# EasyEDA Pro project 电刺激_两块板_2026-10-19.epro, board PCB1
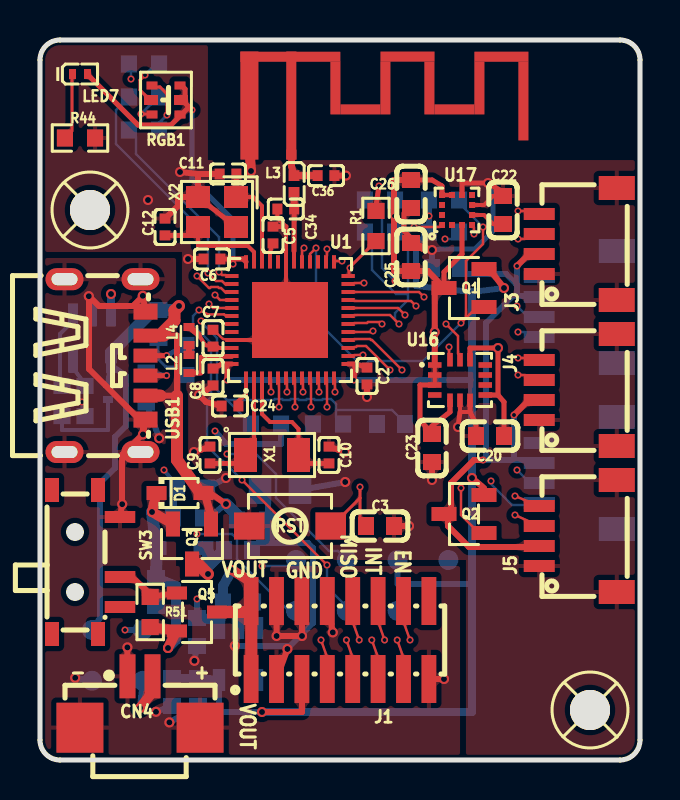
[diagram p7: board, top side]
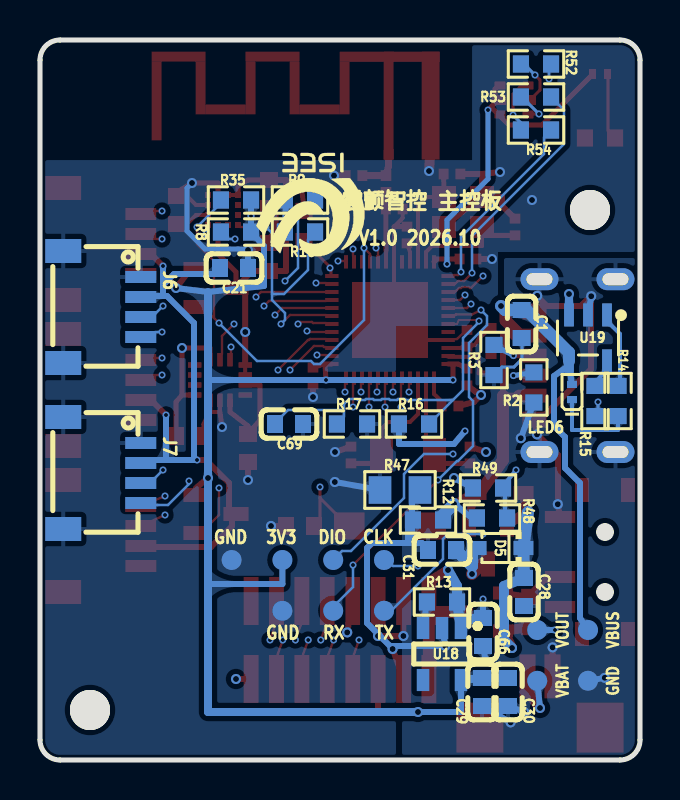
[diagram p8: board, bottom side, seen from below]

Outline 30 x 36 mm; copper layers: Top Layer, GND, SIG_PWR, Bottom Layer. Coordinates in mm from the lower left corner of the outline.
Outline path: 0,35 0,1 arc(0.29,0.29) 1,0 29,0 arc(29.71,0.29) 30,1 30,35 arc(29.71,35.71) 29,36 1,36 arc(0.29,35.71) 0,35
Stack: Top Layer 0.035mm Outer layer thickness 1oz / Dielectric1 0.2104mm 7628 RC49% 8.6mil / GND 0.035mm / Dielectric2 1.065mm 1.1mm H/HOZ Copper / SIG_PWR 0.035mm / Dielectric3 0.2104mm 7628 RC49% 8.6mil / Bottom Layer 0.035mm Outer layer thickness 1oz

## Design rules (mm)
net VBUS: PWR
net VBAT: PWR
net VOUT: PWR
net $1N356: RF
net $1N358: RF
net VOUT_IN: PWR
spacing copperThickness1oz (default): track to track 0.102, other pairs 0 to 0.3
spacing copperThickness2oz: track to track 0.203, other pairs 0.152 to 0.3
spacing HV_0.6mm: track to track 0.6, other pairs 0.152 to 0.6
track width copperThickness1oz (default): min 0.1, default 0.2, max 2.54
track width copperThickness2oz: min 0.203, default 0.254, max 2.54
track width HV_0.3: min 0.2, default 0.3, max 2.54
track width PWR_0.5: min 0.3, default 0.5, max 5
track width RF_50R: min 0.2, default 0.35, max 0.4
differential pair differentialPair (default): width min 0.127, default 0.254, max 2.54; gap min 0.152, default 0.152
net VBAT uses PWR_0.5
net VOUT uses PWR_0.5
net $1N356 uses RF_50R
net $1N358 uses RF_50R
net VOUT_IN uses PWR_0.5
net VBUS uses PWR_0.5
net class RF uses RF_50R
net class PWR uses PWR_0.5

## Placement (name value [footprint] x y rotation side)
C1  10uF  [C0603]  5.92 21.8 90 bottom
C2  100nF  [C0402]  16.35 19.2 270 top
C3  100nF  [C0603]  17 11.7 0 top
C5  100pF  [C0402]  11.65 26.25 90 top
C6  100nF  [C0402]  8.6 25.05 0 top
C7  1uF  [C0402]  8.65 21.09 270 top
C8  10uF  [C0402]  8.65 19.15 90 top
C9  12pF  [C0402]  8.5 15.25 90 top
C10  12pF  [C0402]  14.45 15.25 90 top
C11  12pF  [C0402]  9.4 29.3 180 top
C12  12pF  [C0402]  6.25 26.65 90 top
C20  10uF  [C0603]  22.5 16.2 0 top
C21  10uF  [C0603]  20.3 24.6 0 bottom
C22  220nF  [C0603]  23.15 27.5 270 top
C23  100nF  [C0603]  19.6 15.6 90 top
C24  100nF  [C0402]  9.5 17.7 0 top
C25  100nF  [C0603]  18.55 25.15 90 top
C26  100nF  [C0603]  18.55 28.3 90 top
C28  10uF  [C0603]  5.8 8.4 90 bottom
C29  10uF  [C0603]  7.9 3.4 90 bottom
C30  100nF  [C0603]  6.6 3.4 90 bottom
C31  10uF  [C0603]  9.9 10.5 180 bottom
C34  0.8pF  [C0402]  12.29 27.55 0 top
C36  1.2pF  [C0402]  14.3 29.22 0 top
C66  100nF  [C0603]  7.85 6.4 90 bottom
C69  100nF  [C0603]  17.55 16.8 0 bottom
CN4  HC-1.25-2PWT  [CONN-SMD_2P-P1.25-HC-1.25-2PWT]  5 2.9 0 top
D1  1N5819WS  [SOD-323_L1.8-W1.3-LS2.5-RD]  7 13.35 0 top
D5  1N5819WS  [SOD-323_L1.8-W1.3-LS2.5-RD]  7 10.6 0 bottom
J1  1.27mm,排针2*8P  [HDR-SMD_16P-P1.27-V-M-R2-C8-LS5.3]  15 6 0 top
J3  SM04B-SRSS-TB(LF)(SN)  [CONN-SMD_4P-P1.00_SM04B-SRSS-TB-LF-SN]  26.9 25.8 90 top
J4  SM04B-SRSS-TB(LF)(SN)  [CONN-SMD_4P-P1.00_SM04B-SRSS-TB-LF-SN]  26.9 18.5 90 top
J5  SM04B-SRSS-TB(LF)(SN)  [CONN-SMD_4P-P1.00_SM04B-SRSS-TB-LF-SN]  26.9 11.2 90 top
J6  SM04B-SRSS-TB(LF)(SN)  [CONN-SMD_4P-P1.00_SM04B-SRSS-TB-LF-SN]  26.9 22.65 270 bottom
J7  SM04B-SRSS-TB(LF)(SN)  [CONN-SMD_4P-P1.00_SM04B-SRSS-TB-LF-SN]  26.9 14.35 270 bottom
L2  10uH  [IND-SMD_L1.0-W0.5-2]  7.45 19.8 90 top
L3  3.9nH  [L0402]  12.7 28.8 90 top
L4  15nH  [IND-SMD_L1.0-W0.5-2]  7.45 21.2 90 top
LED6  NCD0402R1  [LED-SMD_L1.0-W0.5_FC-F1005UGK]  3.4 18.4 90 bottom
LED7  NCD0402R1  [LED-SMD_L1.0-W0.5_FC-F1005UGK]  2 34.3 0 top
Q1  NX2301P,215  [SOT-23-3_L2.9-W1.3-P1.90-LS2.4-BR#2]  21.2 23.6 0 top
Q2  NX2301P,215  [SOT-23-3_L2.9-W1.3-P1.90-LS2.4-BR#2]  21.2 12.3 0 top
Q3  SI2301  [SOT-23-3_L2.9-W1.3-P1.90-LS2.4-BR#2]  7.6 10.8 90 top
Q5  NX2301P,215  [SOT-23-3_L2.9-W1.3-P1.90-LS2.4-BR]  7.85 7.4 180 top
R1  10kΩ  [R0603]  16.8 26.7 90 top
R2  5.1kΩ  [R0603]  5.31 18.63 90 bottom
R3  5.1kΩ  [R0603]  7.3 20 90 bottom
R8  470kΩ  [R0603]  20.2 26.4 0 bottom
R9  1.1kΩ  [R0603]  17 28 0 bottom
R10  1.1kΩ  [R0603]  17 26.4 0 bottom
R12  10kΩ  [R0603]  10.6 12 180 bottom
R13  10kΩ  [R0603]  9.9 7.9 180 bottom
R14  1kΩ  [R0603]  1.1 17.95 270 bottom
R15  4.7kΩ  [R0603]  2.25 17.95 270 bottom
R16  1.1MΩ  [R0603]  11.3 16.8 0 bottom
R17  1.1MΩ  [R0603]  14.4 16.8 0 bottom
R35  470kΩ  [R0603]  20.2 28 0 bottom
R44  1kΩ  [R0603]  2 31.1 0 top
R47  0Ω  [R0805]  12 13.5 0 bottom
R48  100kΩ  [R0603]  7.4 12.1 0 bottom
R49  100kΩ  [R0603]  7.6 13.6 180 bottom
R51  100kΩ  [R0603]  5.51 7.4 90 top
R52  470Ω  [R0603]  5.2 34.8 0 bottom
R53  100Ω  [R0603]  5.2 33.15 0 bottom
R54  100Ω  [R0603]  5.2 31.5 0 bottom
RF1  RF_2.4G_ANT  [天线封装]  11.53 30.4 0 top
RGB1  19-337/R6GHBHC-A01/2T  [LED-ARRAY-SMD_6P-L1.6-W1.6-TL]  6.3 33 0 top
RST  轻触开关3x4x2  [Key_SMD_3x4x2]  12.5 11.7 0 top
SCREW3  -  [M2螺丝]  2.5 27.5 0 top
SCREW4  -  [M2螺丝]  27.5 2.5 0 top
SW3  MSK12C02  [SW-TH_MSK12C02]  2.3 9.9 270 top
TP1  -  [Test-Point-0.5mm]  20.42 10 0 bottom
TP2  -  [Test-Point-0.5mm]  12.8 10 0 bottom
TP3  -  [Test-Point-0.5mm]  15.34 10 0 bottom
TP4  -  [Test-Point-0.5mm]  17.88 10 0 bottom
TP5  -  [Test-Point-0.5mm]  17.88 7.46 0 bottom
TP6  -  [Test-Point-0.5mm]  12.8 7.46 0 bottom
TP7  -  [Test-Point-0.5mm]  15.34 7.46 0 bottom
TP20  -  [Test-Point-0.5mm]  2.6 6.5 0 bottom
TP21  -  [Test-Point-0.5mm]  5.14 3.96 0 bottom
TP22  -  [Test-Point-0.5mm]  5.14 6.5 0 bottom
TP23  -  [Test-Point-0.5mm]  2.6 3.96 0 bottom
U1  NRF52832-QFAA-R  [QFN-48_L6.0-W6.0-P0.40-BL-EP3.8]  12.5 22 0 top
U16  LSM6DS3TR-C  [LGA-14_L3.0-W2.5-P0.50-TL]  21 19 0 top
U17  LIS2MDLTR  [VLGA-12_L2.0-W2.0-P0.50-BL]  20.85 27.5 0 top
U18  AP2112K-3.3TRG1  [SOT-25-5_L2.9-W1.6-P0.95-LS2.8-BL]  9.9 5.3 0 bottom
U19  MCP73831T-2ACI/OT  [SOT-23-5_L3.0-W1.7-P0.95-LS2.8-BL]  2.6 21.1 0 bottom
USB1  TYPE-C 6P  [TYPE-C-SMD_TYPE-C-6P_1]  3.25 19.72 270 top
X1  32.768kHz  [OSC-SMD_2P-L3.2-W1.5]  11.6 15.25 0 top
X2  32MHz  [CRYSTAL-SMD_4P-L2.5-W2.0-BL]  8.85 27.4 180 top

## Footprints (pads in the part's own frame, mm; a bottom-side part is the same pattern mirrored in y, then rotated)
C0402
  rect 0.5x0.54 smd: 1(-0.42,0) 2(0.42,0)
C0603
  rect 0.8x0.9 smd: 1(-0.7,0) 2(0.7,0)
CONN-SMD_2P-P1.25-HC-1.25-2PWT
  rect 0.8x2.2 smd: 1(-0.625,1.285) 2(0.625,1.285)
  rect 2.35x2.5 smd: 3(-3.005,-1.285) 4(3.005,-1.285)
CONN-SMD_4P-P1.00_SM04B-SRSS-TB-LF-SN
  rect 0.6x1.55 smd: 1(-1.5,1.938) 2(-0.5,1.938) 3(0.5,1.938) 4(1.5,1.938)
  rect 1.2x1.8 smd: 5(2.8,-1.938) 6(-2.8,-1.938)
CRYSTAL-SMD_4P-L2.5-W2.0-BL
  rect 1.2x1.1 smd: 1(-0.95,-0.75) 2(0.95,-0.75) 3(0.95,0.75) 4(-0.95,0.75)
HDR-SMD_16P-P1.27-V-M-R2-C8-LS5.3
  rect 0.74x2.4 smd: 1(-4.445,-1.95) 2(-4.445,1.95) 3(-3.175,-1.95) 4(-3.175,1.95) 5(-1.905,-1.95) 6(-1.905,1.95) 7(-0.635,-1.95) 8(-0.635,1.95) 9(0.635,-1.95) 10(0.635,1.95) 11(1.905,-1.95) 12(1.905,1.95) 13(3.175,-1.95) 14(3.175,1.95) 15(4.445,-1.95) 16(4.445,1.95)
IND-SMD_L1.0-W0.5-2
  rect 0.4x0.55 smd: 1(-0.45,0) 2(0.45,0)
Key_SMD_3x4x2
  rect 1.53x1.36 smd: 1(-2.035,0) 2(2.035,0)
L0402
  rect 0.54x0.54 smd: 1(-0.42,0) 2(0.42,0)
LED-ARRAY-SMD_6P-L1.6-W1.6-TL
  rect 0.55x0.4 smd: 1(-0.7,0.725) 3(-0.7,-0.725) 4(0.7,0.725) 6(0.7,-0.725)
  rect 0.7x0.5 smd: 2(-0.75,0) 5(0.75,0)
LED-SMD_L1.0-W0.5_FC-F1005UGK
  rect 0.35x0.5 smd: 1(-0.375,0) 2(0.375,0)
LGA-14_L3.0-W2.5-P0.50-TL
  rect 0.675x0.28 smd: 1(-1.262,0.75) 2(-1.262,0.25) 3(-1.262,-0.25) 4(-1.262,-0.75) 8(1.262,-0.75) 9(1.262,-0.25) 10(1.262,0.25) 11(1.262,0.75)
  rect 0.28x0.675 smd: 5(-0.5,-1.012) 6(0,-1.012) 7(0.5,-1.012) 12(0.5,1.012) 13(0,1.012) 14(-0.5,1.012)
M2螺丝
  round 2 hole 2: 1(0,0)
OSC-SMD_2P-L3.2-W1.5
  rect 1.15x1.7 smd: 1(-1.325,0) 2(1.325,0)
QFN-48_L6.0-W6.0-P0.40-BL-EP3.8
  rect 0.2x0.665 smd: 1(-2.2,-2.908) 2(-1.8,-2.908) 3(-1.4,-2.908) 4(-1,-2.908) 5(-0.6,-2.908) 6(-0.2,-2.908) 7(0.2,-2.908) 8(0.6,-2.908) 9(1,-2.908) 10(1.4,-2.908) 11(1.8,-2.908) 12(2.2,-2.908) 25(2.2,2.908) 26(1.8,2.908) 27(1.4,2.908) 28(1,2.908) 29(0.6,2.908) 30(0.2,2.908) 31(-0.2,2.908) 32(-0.6,2.908) 33(-1,2.908) 34(-1.4,2.908) 35(-1.8,2.908) 36(-2.2,2.908)
  rect 0.665x0.2 smd: 13(2.908,-2.2) 14(2.908,-1.8) 15(2.908,-1.4) 16(2.908,-1) 17(2.908,-0.6) 18(2.908,-0.2) 19(2.908,0.2) 20(2.908,0.6) 21(2.908,1) 22(2.908,1.4) 23(2.908,1.8) 24(2.908,2.2) 37(-2.908,2.2) 38(-2.908,1.8) 39(-2.908,1.4) 40(-2.908,1) 41(-2.908,0.6) 42(-2.908,0.2) 43(-2.908,-0.2) 44(-2.908,-0.6) 45(-2.908,-1) 46(-2.908,-1.4) 47(-2.908,-1.8) 48(-2.908,-2.2)
  rect 3.8x3.8 smd: 49(0,0)
R0603
  rect 0.806x0.864 smd: 1(-0.753,0) 2(0.753,0)
R0805
  rect 1.133x1.377 smd: 1(-1,0) 2(1,0)
SOD-323_L1.8-W1.3-LS2.5-RD
  rect 1x0.7 smd: 1(-1.173,0) 2(1.173,0)
SOT-23-3_L2.9-W1.3-P1.90-LS2.4-BR
  rect 1x0.65 smd: 1(1,-0.95) 2(1,0.95) 3(-1,0)
SOT-23-3_L2.9-W1.3-P1.90-LS2.4-BR#2
  rect 1.25x0.7 smd: 1(1,-0.95) 2(1,0.95) 3(-1,0)
SOT-23-5_L3.0-W1.7-P0.95-LS2.8-BL
  rect 0.49x1.157 smd: 1(-0.95,-1.153) 2(0,-1.153) 3(0.95,-1.153)
  rect 0.49x1.175 smd: 4(0.95,1.153) 5(-0.95,1.153)
SOT-25-5_L2.9-W1.6-P0.95-LS2.8-BL
  rect 0.623x1.105 smd: 1(-0.95,-1.3) 2(-0.001,-1.3) 3(0.95,-1.3) 4(0.95,1.3) 5(-0.95,1.3)
SW-TH_MSK12C02
  rect 0.6x1.524 smd: 1(-2.25,1.7) 2(0.75,1.7) 3(2.25,1.7)
  rect 1.2x0.7 smd: 4(-3.6,0.6) 4(-3.6,-1.7) 4(3.6,0.6) 4(3.6,-1.7)
Test-Point-0.5mm
  round 1 smd: 1(0,0)
TYPE-C-SMD_TYPE-C-6P_1
  oval 1.1x1.9 hole 0.6x1.3: 7(-4.32,1.775) 7(-4.32,-2.025) 7(4.32,1.775) 7(4.32,-2.025)
  rect 0.7x1.2 smd: A5(-0.5,2.025) A9(1.5,2.025) B5(0.5,2.025) B9(-1.5,2.025)
  rect 0.8x1.2 smd: A12(2.7,2.025) B12(-2.7,2.025)
VLGA-12_L2.0-W2.0-P0.50-BL
  rect 0.3x0.3 smd: 1(-0.75,-0.75) 2(-0.25,-0.75) 3(0.25,-0.75) 4(0.75,-0.75) 5(0.75,-0.25) 6(0.75,0.25) 7(0.75,0.75) 8(0.25,0.75) 9(-0.25,0.75) 10(-0.75,0.75) 11(-0.75,0.25) 12(-0.75,-0.25)
天线封装
  rect 0.5x0.5 smd: 1(1.046,-0.129)
  custom 0.6x0.8 smd: 2(-1.046,0.129)

## Nets
As in the schematic, except:
$1N358: C36.1 L3.2 RF1.1

Pads without a net: J1 16; SCREW3 1; SCREW4 1; SW3 3 4; U1 27 44; U16 4 9 10 11; U17 2 7 11 12; U18 4

## Via types
v1: diameter 0.508, hole 0.3, Top Layer to Bottom Layer, 18 vias
v2: diameter 0.35, hole 0.2, Top Layer to Bottom Layer, 83 vias
v3: diameter 0.5, hole 0.3, Top Layer to Bottom Layer, 27 vias
v4: diameter 0.356, hole 0.2, Top Layer to Bottom Layer, 1 via

## Routing (per net, layer and track width the routed paths; a pad name or vN(x,y) marks a point on that pad's centre or on a via; arc(x,y) is an arc through that point)
DGND: length 44.9
  Top Layer w0.12: 8.85,21.33 9.15,21.05 9.6,21
  Top Layer w0.2: 11.87,27.55 11.87,27.1 12.3,26.67 U1.31 12.3,23.8 ; U17.6 22.2,27.75 22.65,28.2 C22.1 ; 9.59,21 10.7,21 ; 21,17.99 21,17.4 21.5,17.4
  Top Layer w0.25: 11.65,26.67 12.3,26.67 ; 21,17.4 v3(20.9,16.65) ; 21.5,17.99 21.5,17.4 21.8,16.8 C20.1 ; X2.4 7.9,28.15 ; 18.2,27.35 18.2,26.45 19.1,25.55 19.45,25.55 ; U17.8 21.1,28.85 v3(22.4,28.85) 23.15,28.4
  Top Layer w0.3: 7.9,29.3 7.9,28.15 6.9,28.15 6.9,27.7 6.25,27.07 ; 7.9,29.3 C11.2 ; 7.9,29.3 v3(7,29.4) ; C24.1 8.3,17.9 v3(7.95,18.25) 8.2,18.4 8.65,18.73 ; C23.1 v3(19.6,14) ; C9.2 v3(7.7,15.4) ; C2.2 v3(16.35,18.15) ; C3.2 v1(18.45,11.7) ; v3(19.6,25.5) C25.2 ; C36.2 v3(15.3,29.22) ; C10.2 v3(15.25,15.4) ; C6.1 v3(7.4,25.05)
  Top Layer w0.5: 10.48,30.4 v3(10.55,29.45)
  Bottom Layer w0.25: v3(22.4,28.85) 22.65,28.6 22.65,26.45 21.75,25.55 20.1,25.55 v3(19.6,25.5)
  Bottom Layer w0.3: 8.35,13.6 v3(9.3,14.1) ; v3(19.6,25.5) C21.1 ; R47.2 v1(15.26,13.9)
  vias: v3(5.4,28)
GND: length 54.1
  Top Layer w0.3: 13.1,7.95 v1(13.1,6.2) 11.85,6.2 ; 5.14,23.19 5.15,23.2 ; 5.14,23.19 5.28,22.42 ; 5.14,23.19 4.65,22.7 2.95,22.7 2.45,23.2 2.45,19.55 5.15,16.85 5.15,16.3 4.1,15.25 4.1,12.8 ; 5.14,23.19 v1(5.14,23.21) ; 11.83,7.95 v1(11.83,6.2) ; 14.37,7.95 v1(14.64,6.38) ; SW3.1 v1(4.11,12.79) ; 19.45,4.05 v1(20.2,4.05) ; 11.83,4.05 v1(12.37,5.55) ; 5.28,17.02 v1(5.15,16.28) ; 4.37,4.18 v1(4.37,5.63)
  SIG_PWR w0.15: v2(2.1,17.9) 2.1,15.85
  SIG_PWR w0.3: 5.15,15.8 5.15,16.3
  Bottom Layer w0.15: 2.1,17.55 v2(2.1,17.9) ; 5.9,20.75 5.9,20.05 6.3,19.65 6.9,19.65 6.95,19.6
  Bottom Layer w0.3: 9.9,6.6 v1(9.74,5.71) ; 7.85,5.7 v1(7.72,4.96) ; C29.1 v1(6.47,1.88) ; 6.6,2.7 v1(5.8,2.41) ; 11.4,10.85 11.6,10.85 ; 11.4,10.85 10.9,10.85 10.85,10.8 ; 11.4,10.85 11.4,12.95 ; 11.6,10.85 11.6,11.7 ; 11.6,10.85 13.4,10.85 13.65,10.6 13.65,6.85 12.5,5.7 9.75,5.7 ; U19.2 v1(2.44,23.19) ; TP23.1 v1(1.76,4.11) ; R2.1 v1(5.96,16.09)
VBAT: length 45.6
  Top Layer w0.5: 5.63,3.4 v3(5,2.6)
  Top Layer w0.6: v3(8.4,9.3) 7.9,9.8 Q3.3
  SIG_PWR w0.3: v3(8.4,9.3) 8.7,9.8 8.7,16 v2(8.75,16.45)
  SIG_PWR w0.6: 3.1,9.3 3.1,22.85 v3(3.55,23.3) ; 3.1,9.3 v3(8.4,9.3) ; 3.1,9.3 3.1,3.4 3.9,2.6 v3(5,2.6)
  Bottom Layer w0.3: TP21.1 v3(5,2.6) ; v2(8.75,16.45) 9.3,15.8 12.05,15.8 12.05,16.37
  Bottom Layer w0.4: 3.55,22.25 v3(3.55,23.3)
  Bottom Layer w0.6: D5.2 8.4,10.37 8.4,9.7 C31.2
VBUS: length 37
  Top Layer w0.3: 8.5,13.35 v3(9.3,12.8) ; 6.2,21.22 6.85,21.22 6.85,18.22 6.03,18.22
  Top Layer w0.4: 8.3,13.1 8.55,12.2
  Top Layer w0.6: D1.2 8.02,13.35 6.85,15 6.85,18.22 ; 6.2,21.22 USB1.B9 ; v3(6.95,22.7) 6.72,22.47 6.72,21.97 5.99,21.24 ; USB1.A9 6.03,18.22
  Bottom Layer w0.3: 3.6,19.7 4.3,19.2 4.3,16.7 3.75,16.15 3.75,14.6 3,13.85 3,7.1 TP20.1 ; 8.4,12.1 v3(9.3,12.8) ; 3.5,19.4 3.42,18.9
  Bottom Layer w0.6: R12.2 9.85,12.25 v3(9.3,12.8) ; U19.4 3.55,20.37 5.68,22.5 C1.2 6.75,22.5 v3(6.95,22.7)
VBUS_DET: length 12.5
  Top Layer w0.12: v2(8.75,23.25) 9,23 9.59,23
  SIG_PWR w0.15: v2(6.2,14.5) 6.2,14.7 7.45,15.95 7.45,22.6 8.1,23.25 v2(8.75,23.25)
  Bottom Layer w0.2: v2(6.2,14.5) 6.6,14 ; 6.75,12.5 6.75,13.2
VDD: length 99.6
  Top Layer w0.25: v2(15.7,19) 15.75,19.75 ; v2(16.95,28.7) 16.8,27.7 ; 8.65,19.57 9.1,19.8 9.59,19.8 ; U1.13 15.8,19.8 C2.1 ; v2(9.35,19) 9.35,19.75 ; v2(7.6,32.5) 7.25,32.85 7.25,33.55 7.15,33.65 ; 2.45,34.2 4.9,31.75 6.55,31.75 7.45,32.65
  Top Layer w0.254: U1.36 10.16,25.05 9.65,25.05 ; v4(9.65,24.8) 9.65,25.05 ; 9.65,25.05 C6.2
  Top Layer w0.3: v3(21.6,14.1) 22.2,13.6 ; v3(11.1,2.4) 13.1,2.4 13.1,3 ; v3(23.2,23.6) 22.5,24.5
  SIG_PWR w0.25: v2(16.95,28.7) 18.4,28.7 v2(19.45,27.2)
  SIG_PWR w0.3: v2(9.35,19) 9.95,19.6 9.95,24.5 v4(9.65,24.8)
  Bottom Layer w0.25: v2(7.6,32.5) 7.6,29.05 9.65,27 v4(9.65,24.8)
  Bottom Layer w0.3: 19.45,28 19.45,26.4 18.8,25.7 18.8,23.7 21.6,23.4 v3(23.2,23.6) ; v3(11.1,2.4) 8.95,2.4 U18.5 ; v2(9.35,19) v2(15.7,19) 21.6,19 ; 21.6,8.8 17.88,8.8 17.88,9.5
  Bottom Layer w0.4: U18.5 C29.2 C30.2 ; 21.6,23.4 21.6,2.4 v3(11.1,2.4)
VDD_EXT: length 28.1
  Top Layer w0.3: 24.35,17.9 v2(23.7,17.25) ; v2(22.15,15) 21.7,15 20.55,13.85 20.55,12.5 ; 24.35,25.2 v2(23.85,24.7) ; 24.35,10.65 21.45,10.65 20.4,11.7 20.4,12.1
  Bottom Layer w0.3: 23.85,23.75 23.85,23.2 ; 23.85,23.75 23.3,24.3 21.25,24.3 ; 23.85,23.75 v2(23.85,24.7) ; 23.85,23.2 24.35,23.2 ; 23.85,23.2 23.65,23.2 22.3,21.85 22.3,15 ; 23.7,15 22.3,15 ; 23.7,15 v2(23.7,17.25) ; 23.7,15 24.35,15 ; 22.3,15 v2(22.15,15)
VDD_MAIN: length 36.8
  Top Layer w0.2: 19.74,19.75 U16.2 19.74,18.75 ; U17.9 U17.10
  Top Layer w0.25: 22.9,18.25 23.2,17.9 C20.2 ; 22.9,18.25 22.26,18.25 ; 22.9,18.25 v3(22.9,20.6) 21.5,20.6 U16.12 ; C26.2 19.6,29 20.1,28.7 U17.10 ; 20.5,17.99 20.5,17.4 19.6,16.7 C23.2 19,17 19,18.75 19.74,18.75 ; Q1.3 20.2,24.4 21.1,25.3 21.1,26.75
  Top Layer w0.3: 19.74,19.75 19.74,23.6 ; Q1.3 19.4,24.45 17.7,24.45 17.7,29 C26.2
  SIG_PWR w0.3: v3(22.9,20.6) v3(19.74,21.4)
  Bottom Layer w0.3: 17.75,28 v2(17.7,27.2) 17.75,26.4
32KI: length 5.1
  Top Layer w0.2: U1.2 10.7,15.8
  Top Layer w0.25: 8.5,14.83 10.27,14.83
32KO: length 6.2
  Top Layer w0.2: U1.3 11.1,17.3 11.5,16.9 12.6,16.9 12.93,16.55 12.93,15.8
  Top Layer w0.25: 14.45,14.83 12.93,14.83
BAT_AD: length 17
  Top Layer w0.1: 9.59,21.8 9.15,21.8 9.06,22 8.05,22 v2(8.05,21.95)
  Bottom Layer w0.12: 14.8,17.5 17.6,17.5 17.9,17.2 ; 14.8,17.5 14.8,17.15 ; 14.8,17.5 14.8,17.8 14.55,18.05 14.15,18.05 14.1,18 13.75,18 13.7,18.05 13.35,18.05 13.3,18 12.95,18 12.9,18.05 12.55,18.05 12.5,18 12.15,18 12.1,18.05 11.75,18.05 11.7,18 9.35,18 ; 9.35,18 8.85,18.5 8.85,21.1 8.05,21.9 v2(8.05,21.95) ; 9.35,18 10.2,17.15
EN_VDD_EXT: length 26.2
  Top Layer w0.12: v2(13.2,25.6) 13.1,25.5 13.1,25.2 ; v2(21.05,13.6) 21.05,12.25 21.65,11.65
  SIG_PWR w0.12: 15.6,22.45 15.6,24.1 15.95,24.45 15.95,24.75 14.65,26.05 13.65,26.05 v2(13.2,25.6) ; 15.6,22.45 17.55,24.4 17.8,24.4 19.45,26.05 v2(20.25,26.05) ; 15.6,22.45 15.6,19.8 21.05,14.35 v2(21.05,13.6)
  Bottom Layer w0.12: 20.6,26.05 v2(20.25,26.05)
EN_VDD_MAIN: length 20.3
  Top Layer w0.12: 21.3,22.1 21.3,24.95 22.15,25.8 v2(22.15,26.65) ; 21.3,22.1 v2(21.05,21.85) ; 21.3,22.1 21.65,22.45 ; 13.5,25.2 13.5,25.3 v2(13.8,25.6)
  Bottom Layer w0.12: v2(21.05,21.85) 19.15,19.95 16.45,19.95 16.3,19.8 16,19.8 13.8,22 v2(13.8,25.6) ; 21.15,27.65 v2(22.15,26.65)
NNC_INT: length 17.4
  Top Layer w0.12: 13.15,19.05 v2(13.15,18.4) ; v2(17.23,6) 16.91,6.9
  SIG_PWR w0.12: v2(13.15,18.4) 13.15,9.21 14.26,8.1 17.23,8.1 v2(17.23,6)
NNC_NRST: length 17.7
  Top Layer w0.12: v2(17.86,6) 18.18,5.1 ; 13.55,19.05 v2(13.55,17.65)
  SIG_PWR w0.12: v2(13.55,17.65) 13.55,9.42 14.52,8.45 17.86,8.45 v2(17.86,6)
PWR_SW_G: length 2.3
  Top Layer w0.3: 4.6,9.15 5.3,8.5 ; 5.51,8.15 Q5.1
RESET: length 15.9
  Top Layer w0.15: 15.45,24.25 15.45,24.6 15.5,24.65 ; 16,13.1 v2(16,13.65) ; 16,13.1 16,12.1 ; 16,13.1 15.2,12.3 ; v2(15.5,24.6) 15.5,24.65 ; 15.5,24.65 16.45,25.6
  SIG_PWR w0.15: v2(15.5,24.6) 15.2,24.3 15.2,19 15.25,18.95 15.25,18.85 15.8,18.3 15.8,13.85 v2(16,13.65)
RGB_B: length 8.9
  Top Layer w0.12: 9.3,24.25 9.1,24.25 v2(8.95,24.4)
  Bottom Layer w0.12: 4.8,31.15 4.8,30.3 8.95,26.15 v2(8.95,24.4)
RGB_G: length 11.6
  Top Layer w0.12: v2(8.4,24.35) 8.8,23.95 9.1,23.95 9.3,23.75
  Bottom Layer w0.12: v2(8.4,24.35) 8.4,26.2 3.8,30.8 3.8,32.5 4.1,32.8
RGB_R: length 13.6
  Top Layer w0.12: 9.3,23.35 9.05,23.6 8.95,23.6 8.9,23.65 8.55,23.65 8.5,23.6 8.45,23.6 v2(7.85,24.2)
  SIG_PWR w0.12: v2(7.85,24.2) 7.55,24.2 5.95,25.8 5.95,32.65 v2(4.55,34.05)
  Bottom Layer w0.12: 4.55,34.45 v2(4.55,34.05)
SCL0: length 17.1
  Top Layer w0.12: v2(20.3,21.8) 20.9,21.2 20.9,20.3 ; v2(17.95,21.8) 17.5,22.25 15.7,22.25 ; 20,26.65 v2(18.7,26.65)
  SIG_PWR w0.12: v2(17.95,21.8) 18.4,21.8 18.5,21.9 20.2,21.9 v2(20.3,21.8)
  Bottom Layer w0.12: v2(17.95,21.8) 17.75,22 17.75,22.35 18.4,23 18.4,23.3 ; v2(18.7,26.65) 18.4,26.35 18.4,23.3 ; 18.4,23.3 17.8,23.3 16.6,24.5 16.6,26.05
SCL1: length 11.7
  Top Layer w0.12: v2(16.15,20.25) 15.7,20.25
  SIG_PWR w0.12: v2(22.55,13.95) 22.45,13.95 v2(16.15,20.25)
  Bottom Layer w0.12: v2(22.55,13.95) 22.55,13.8 23.6,12.75 24.25,12.75
SCL2: length 9
  Top Layer w0.12: v2(18.25,22.25) 17.9,22.6 15.7,22.6
  SIG_PWR w0.12: v2(23.9,21.4) 23.05,22.25 v2(18.25,22.25)
  Bottom Layer w0.12: 24.25,21.4 v2(23.9,21.4)
SCL3: length 15.9
  Top Layer w0.12: v2(23.75,13.2) 24.96,12.7 ; 14.75,19.05 v2(14.75,18.4)
  SIG_PWR w0.12: v2(23.75,13.2) 15.26,13.2 14.75,13.71 v2(14.75,18.4)
SCL4: length 10
  Top Layer w0.12: v2(16.2,23.85) 15.7,23.85 ; 24.25,27.45 v2(23.9,27.45)
  SIG_PWR w0.12: v2(16.2,23.85) 17.1,24.75 17.66,24.75 20.35,27.45 v2(23.9,27.45)
SCL5: length 9.1
  Top Layer w0.12: 24.25,20.1 v2(23.9,20.1) ; 15.7,21.4 16.6,21.4 v2(16.65,21.45)
  SIG_PWR w0.12: v2(23.9,20.1) 18,20.1 v2(16.65,21.45)
SDA0: length 18
  Top Layer w0.12: 20.45,20.3 v2(20.45,20.65) ; v2(17.1,21.8) 17,21.9 16.4,21.9 16.35,21.85 15.7,21.85 ; 21.7,26.65 v2(21.7,26.3)
  SIG_PWR w0.12: v2(21.7,26.3) 17.5,22.1 17.5,21.4 ; 17.5,21.4 18.25,20.65 v2(20.45,20.65) ; 17.5,21.4 v2(17.1,21.8) ; 18.4,23 17.75,23.65 v2(17.75,23.95)
  Bottom Layer w0.12: v2(17.75,23.95) 17.1,24.6 17.1,27.15 16.6,27.65
SDA1: length 11.5
  Top Layer w0.12: 15.7,20.65 15.8,20.65 15.85,20.7 16.3,20.7 v2(17.5,19.5)
  SIG_PWR w0.12: v2(17.5,19.5) 18.1,18.9 19.82,18.9 23.85,14.87 v2(23.85,14.5)
  Bottom Layer w0.12: 24.25,14.1 v2(23.85,14.5)
SDA2: length 8.8
  Top Layer w0.12: 15.7,22.95 18.55,22.95 v2(18.8,22.7)
  SIG_PWR w0.12: v2(23.85,22.7) v2(18.8,22.7)
  Bottom Layer w0.12: 24.25,22.3 v2(23.85,22.7)
SDA3: length 17
  Top Layer w0.12: v2(23.75,12.25) 24.96,11.7 ; 14.35,19.05 v2(14.35,17.65)
  SIG_PWR w0.12: v2(23.75,12.25) 23.6,12.8 15.05,12.8 14.35,13.5 v2(14.35,17.65)
SDA4: length 9.9
  Top Layer w0.12: 24.25,26.05 v2(23.9,26.05) ; v2(19.2,23.15) 18.95,23.4 15.7,23.4
  SIG_PWR w0.12: v2(23.9,26.05) 22.1,26.05 v2(19.2,23.15)
SDA5: length 9.3
  Top Layer w0.12: 24.25,19.25 v2(23.9,19.25) ; 15.7,21.05 16.5,21.05 16.55,21 16.6,21 v2(18.1,19.5)
  SIG_PWR w0.12: v2(23.9,19.25) 23.65,19.5 v2(18.1,19.5)
SPI_CLK: length 15.5
  Top Layer w0.12: 11.55,19.05 v2(11.55,18.4) ; v2(14.05,6) 14.37,5.1
  SIG_PWR w0.12: v2(11.55,18.4) 11.55,8.35 13.2,6.7 14.05,6.7 v2(14.05,6)
SPI_CS: length 17
  Top Layer w0.12: 12.75,19.05 v2(12.75,17.65) ; v2(16.59,6) 16.91,5.1
  SIG_PWR w0.12: v2(16.59,6) 16.59,7.75 14.13,7.75 12.75,9.13 v2(12.75,17.65)
SPI_MISO: length 16.7
  Top Layer w0.12: 12.35,19.05 v2(12.35,18.4) ; v2(15.96,6) 15.64,6.9
  SIG_PWR w0.12: v2(12.35,18.4) 12.35,8.99 13.94,7.4 15.96,7.4 v2(15.96,6)
SPI_MOSI: length 16.4
  Top Layer w0.12: v2(15.32,6) 15.64,5.1 ; 11.95,19.05 v2(11.95,17.65)
  SIG_PWR w0.12: v2(15.32,6) 15.32,7.05 13.63,7.05 11.95,8.73 v2(11.95,17.65)
STIM_EN_N: length 18.1
  Top Layer w0.12: v2(18.5,6) 18.18,6.9 ; 13.95,19.05 v2(13.95,18.4)
  SIG_PWR w0.12: v2(13.95,18.4) 13.95,9.5 14.65,8.8 18.5,8.8 v2(18.5,6)
SWCLK: length 19
  Top Layer w0.12: v2(15.1,24.95) 14.75,24.95
  SIG_PWR w0.12: v2(15.1,24.95) 14.85,24.7 14.85,22.6 11.1,18.85 v2(11.1,9.7)
  Bottom Layer w0.12: v2(11.1,9.7) 12.35,9.7 TP2.1
SWDIO: length 21.6
  Top Layer w0.12: v2(14.35,25.55) 14.35,25.2
  SIG_PWR w0.12: v2(9.35,15.3) 10.75,16.7 10.75,22 13.95,25.2 14,25.2 v2(14.35,25.55)
  Bottom Layer w0.12: TP3.1 14.9,10.45 14.45,10.45 11.8,13.1 11.8,14.3 10.8,15.3 v2(9.35,15.3)
UART_RX: length 19.8
  Top Layer w0.12: v2(7.95,22.5) 8.4,22.28 9.2,22.28 9.3,22.2 9.59,22.2 ; v2(14.35,9.75) v2(10.1,14)
  Bottom Layer w0.12: v2(14.35,9.75) 14.35,8.65 15.15,7.85 ; v2(10.1,14) 9.15,14.95 9.1,14.95 8.35,15.7 8.35,17.95 8.55,18.15 8.55,20.85 7.65,21.75 7.65,22.2 v2(7.95,22.5)
UART_TX: length 19.7
  Top Layer w0.12: v2(8.45,22.8) 8.65,22.6 9.59,22.6
  SIG_PWR w0.12: v2(7.85,11.3) 8.3,11.75 8.3,17.9 8.45,18.05 v2(8.45,22.8)
  Bottom Layer w0.12: v2(7.85,11.3) 9.6,11.3 9.85,11.05 9.85,10.05 12.4,7.5
VOUT: length 13.8
  Top Layer w0.5: v3(9.6,9.5) 10.4,9
  Top Layer w0.6: 8.85,7.4 10.56,7.4 ; 10.56,6.75 10.56,5.25
  SIG_PWR w0.3: v2(7.85,8.05) v2(4.25,6.5)
  Bottom Layer w0.3: v2(4.25,6.5) TP22.1 ; v2(7.85,8.05) 7.85,7.4
  Bottom Layer w0.5: 8.95,7 C66.2 ; U18.1 9.15,7.9 9.15,8.7 v3(9.6,9.5)
VOUT_IN: length 12
  Top Layer w0.5: Q3.2 v3(5.6,12.4) 5.83,13.35 ; 5.51,6.65 Q5.2 ; v3(6.4,5.6) 6.75,6.3
  Bottom Layer w0.5: v3(6.4,5.6) 6.8,6 6.8,8.7 C28.2
  Bottom Layer w0.6: v3(5.6,12.4) 5.83,10.6 C28.2
XTAL32MI: length 6
  Top Layer w0.2: X2.3 7.9,25.7 10.4,25.7 10.7,25.4 U1.35
  Top Layer w0.25: 6.25,26.23 7.9,26.23
XTAL32MO: length 5.4
  Top Layer w0.2: U1.34 11.1,27.7 10.65,28.15 9.8,28.15
  Top Layer w0.25: C11.1 9.8,28.15
$1N12: length 1.6
  Top Layer w0.2: C24.2 9.92,17.95 10.3,18.3 U1.1
$1N36: length 0.9
  Top Layer w0.2: U1.33 11.5,25.4 11.65,25.83
$1N356: length 3.5
  Top Layer w0.2: U1.30 12.7,25.45
  Top Layer w0.25: 12.71,27.55 12.7,25.45
  Top Layer w0.35: 12.71,27.55 L3.1
$1N358: length 2.2
  Top Layer w0.35: C36.1 L3.2 12.57,29.7 RF1.1
$1N378: length 3
  Top Layer w0.2: 9.59,20.16 8.05,20.16 8.05,19.35
  Top Layer w0.25: 8.05,19.35 L2.1
$1N379: length 0.5
  Top Layer w0.3: 7.45,20.25 L4.1
$1N451: length 2.6
  Top Layer w0.15: 1.6,31.45 1.6,34.1
$1N467: length 2.5
  Top Layer w0.2: 9.59,20.6 8.95,20.6 8.8,20.75 ; C7.2 8.25,20.75 7.95,21.25
  Top Layer w0.3: 7.45,21.65 7.95,21.25
$1N506: length 1.8
  Top Layer w0.15: v2(5.25,34.25) 5,34 5,33.5 5.3,33.2
  Bottom Layer w0.15: v2(5.25,34.25) 5.6,34.6
$1N508: length 1.1
  Top Layer w0.15: 5.4,32.3 v2(5.05,32.3)
  Bottom Layer w0.15: v2(5.05,32.3) 5.6,32.85
$1N510: length 2.3
  Top Layer w0.15: 5.8,33.65 6,33.65 6.35,33.3 v2(6.35,32.25)
  Bottom Layer w0.15: v2(6.35,32.25) 5.95,31.85
$3N5: length 1.3
  Bottom Layer w0.3: 10.65,7.9 U18.3
$3N23: length 4.4
  Bottom Layer w0.2: 1.1,17.1 1.1,16.5 3.4,16.5 LED6.1
$3N28: length 0.7
  Bottom Layer w0.2: 1.65,19.6 2.1,19
$3N31: length 3.1
  Bottom Layer w0.2: 1,18.9 1,21.3 1.5,21.8
$3N61: length 2.1
  Top Layer w0.25: USB1.B5 v2(6.33,19.22)
  Bottom Layer w0.25: v2(6.33,19.22) 5.31,19.38
$3N62: length 2.2
  Top Layer w0.25: 5.28,20.22 v2(6.33,20.22)
  Bottom Layer w0.25: v2(6.33,20.22) 7.3,20.75
$4N4: length 1.7
  Top Layer w0.2: U17.5 22.2,27.25 22.65,26.8 C22.2

## Copper pours and planes (outline as drawn; the poured copper is in the pictures)
DGND on Top Layer: 0.01,35.99 29.99,35.99 29.99,0.01 21.3,0.01 21.3,10 7.1,10 7.1,25.4 0.01,25.4
DGND on Bottom Layer: 0.01,35.99 29.99,35.99 29.99,0.01 12.2,0.01 12.2,21.7 7.1,21.7 7.1,25.4 0.01,25.4
DGND on GND: 0.01,35.99 29.99,35.99 29.99,0.01 21.3,0.01 21.3,10 7.1,10 7.1,25.4 0.01,25.4
GND on Top Layer: 0,25.1 6.8,25.1 6.8,9.7 21,9.7 21,0 0,0
GND on Bottom Layer: 0,25.1 6.8,25.1 6.8,21.4 11.9,21.4 11.9,0 0,0
GND on GND: 0,25.1 6.8,25.1 6.8,9.7 21,9.7 21,0 0,0

Small or netless copper shapes (teardrops, artwork), in the pictures only: 324 on Top Layer, 163 on Bottom Layer, 72 on SIG_PWR

## Text on the board
Bottom Silkscreen Layer: VBUS | GND | VOUT | VBAT | TX | CLK | RX | DIO | 3V3 | V1.0 2026.10 | 震颤智控 主控板
Top Silkscreen Layer: - | + | VOUT | GND | MISO | INT | EN
